# Altium schematic sheet NODEBUS.SchDoc
size A; SheetNumber: 5; SheetTotal: 6
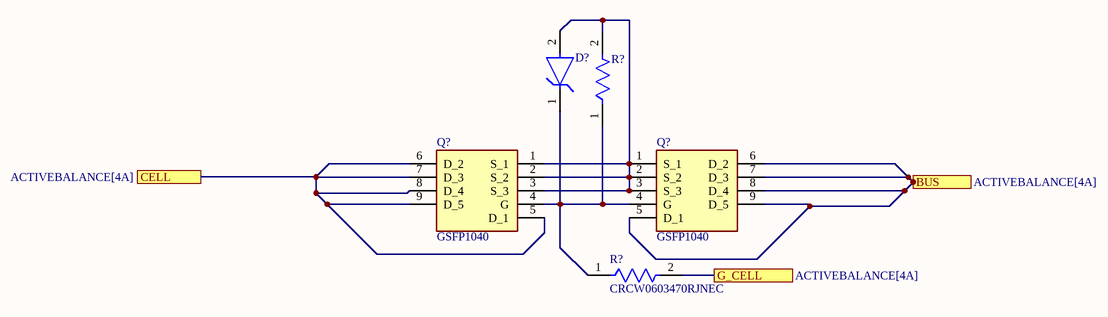
[diagram p0: NODEBUS.SchDoc]

## Parts
(Parts that share a designator on the sheet are numbered #1, #2 ... from top to bottom, then left to right.)
D?  BZT52C18-7-F  [FP-SOD123-MFG]  (value not drawn)
Q?#1  GSFP1040  [FDMS86181]
Q?#2  GSFP1040  [FDMS86181]
R?#1  CPF0603D10KE  [FP-CPF0603-MFG]  (value not drawn)
R?#2  CRCW0603470RJNEC  [FP-CRCW0603-e3-IPC_B]

## Ports
BUS (see ACTIVEBALANCE[4A]), CELL (see ACTIVEBALANCE[4A]), G_CELL (see ACTIVEBALANCE[4A])

## Nets
BUS: Q?#2.5(D_1) Q?#2.6(D_2) Q?#2.7(D_3) Q?#2.8(D_4) Q?#2.9(D_5) ; port BUS
CELL: Q?#1.5(D_1) Q?#1.6(D_2) Q?#1.7(D_3) Q?#1.8(D_4) Q?#1.9(D_5) ; port CELL
G_CELL: R?#2.2 ; port G_CELL
NetD?_1: D?.1(C) Q?#1.4(G) Q?#2.4(G) R?#1.1 R?#2.1
NetD?_2: D?.2(A) Q?#1.1(S_1) Q?#1.2(S_2) Q?#1.3(S_3) Q?#2.1(S_1) Q?#2.2(S_2) Q?#2.3(S_3) R?#1.2

## Library data of the parts
D? = CMP-12792-000007-1: DIODE ZENER 18V 500MW SOD123; Manufacturer: Diodes Inc.; Max Reverse Leakage Current: 0.1uA; Max Zener Voltage: 19.1V; Max Junction Temp: +150°C; Reverse Voltage: 12.6V; Forward Current: 10mA; Standoff Height: 0mm; Zener Impedance: 45Ω; Power Dissipation: 370mW; Temperature Range Low: -65°C; Package: SOD123; Device Class L3: Zener Diodes; Mouser Description: BZT52C18 Series 500 mW 18 V 10 mA Surface Mount Zener Diode - SOD-123; Octopart: https://octopart.com/bzt52c18-7-f-diodes+inc.-326572; Height: 1.45mm; Device Class L1: Discrete Semiconductors; Nom Zener Voltage: 18V; Automotive: No; Device Class L2: Diodes; Category: Diode; Temperature: -65°C to +150°C; Lead Free: Yes; ComponentLink2URL: https://www.diodes.com/assets/Datasheets/ds18004.pdf; Temperature Range High: +150°C; Footprint Url: https://www.diodes.com/assets/Package-Files/SOD123.pdf; Manufacturer Part Number: BZT52C18-7-F; RoHS: TRUE; Digikey Description: DIODE ZENER 18V 500MW SOD123; ComponentLink2Description: Datasheet
Q?#1 Q?#2 = FDMS86181: Transistor; Manufacturer_Name: onsemi; Datasheet Link: https://www.onsemi.com/pub/Collateral/FDMS86181-D.PDF; Height: 1.1mm; Manufacturer_Part_Number: FDMS86181; Mouser Part Number: 512-FDMS86181; Mouser Price/Stock: https://www.mouser.co.uk/ProductDetail/onsemi-Fairchild/FDMS86181?qs=g6T3zOPhKMAXMdf7h8CJTA%3D%3D; Arrow Part Number: FDMS86181; Arrow Price/Stock: https://www.arrow.com/en/products/fdms86181/on-semiconductor?region=europe
R?#1 = CMP-03211-003506-1: RES SMD 10KΩ 0.5% 1/16W 0603; Manufacturer: TE Connectivity; Power Rating: 0.063W; Temperature Coefficient: 25ppm/°C; Voltage Rating: 50V; ComponentLink2Description: Datasheet; packaging: 5k Reel; Automotive: No; Octopart: https://octopart.com/cpf0603d10ke-te+connectivity-22737789; Composition: Thin Film; Value: 10KΩ; Category: Res; RoHS: TRUE; Height: 0.55mm; Lead Free: Yes; ComponentLink2URL: https://www.te.com/commerce/DocumentDelivery/DDEController?Action=showdoc&DocId=Data+Sheet%7F1773200%7FM%7Fpdf%7FEnglish%7FENG_DS_1773200_M.pdf%7F3-1676481-2; Temperature: -55°C to +155°C; Device Class L3: Chip SMD Resistors; Device Class L1: Passive Components; octopart_url: https://octopart.com/cpf0603d10ke-te+connectivity-22737789; Tolerance: 0.5%; Resistance: 10KΩ; Package: CPF0603; Temperature Range High: +155°C; Series: CPF; Manufacturer Part Number: CPF0603D10KE; Temperature Range Low: -55°C; Device Class L2: Resistors; Ipc Land Pattern Name: RESC15580X45
R?#2 = CMP-1012-00066-2: RES Thick Film, 470Ω, 5%, 0.1W, 200ppm/°C, 0603; Resistance: 470R; Power Rating: 100mW; Min Operating Temperature: -55°C; Temperature Coefficient: 200ppm/°C; Composition: Thick Film; Packaging: Tape and Reel; Tolerance: 5%; Height: 0.02inch; Max Operating Temperature: 155°C; Length: 0.061inch; Width: 0.033inch; Features: Automotive AEC-Q200; Number of Terminations: 2; Package Quantity: 20000; Case/Package: 0603; Mount: Surface Mount; Max Power Dissipation: 100mW; Depth: 0.85mm; Military Standard: Not; Lead Free: Lead Free